# Altium schematic sheet DAC_LFO.SchDoc
size A3; SheetNumber: 2; SheetTotal: 12
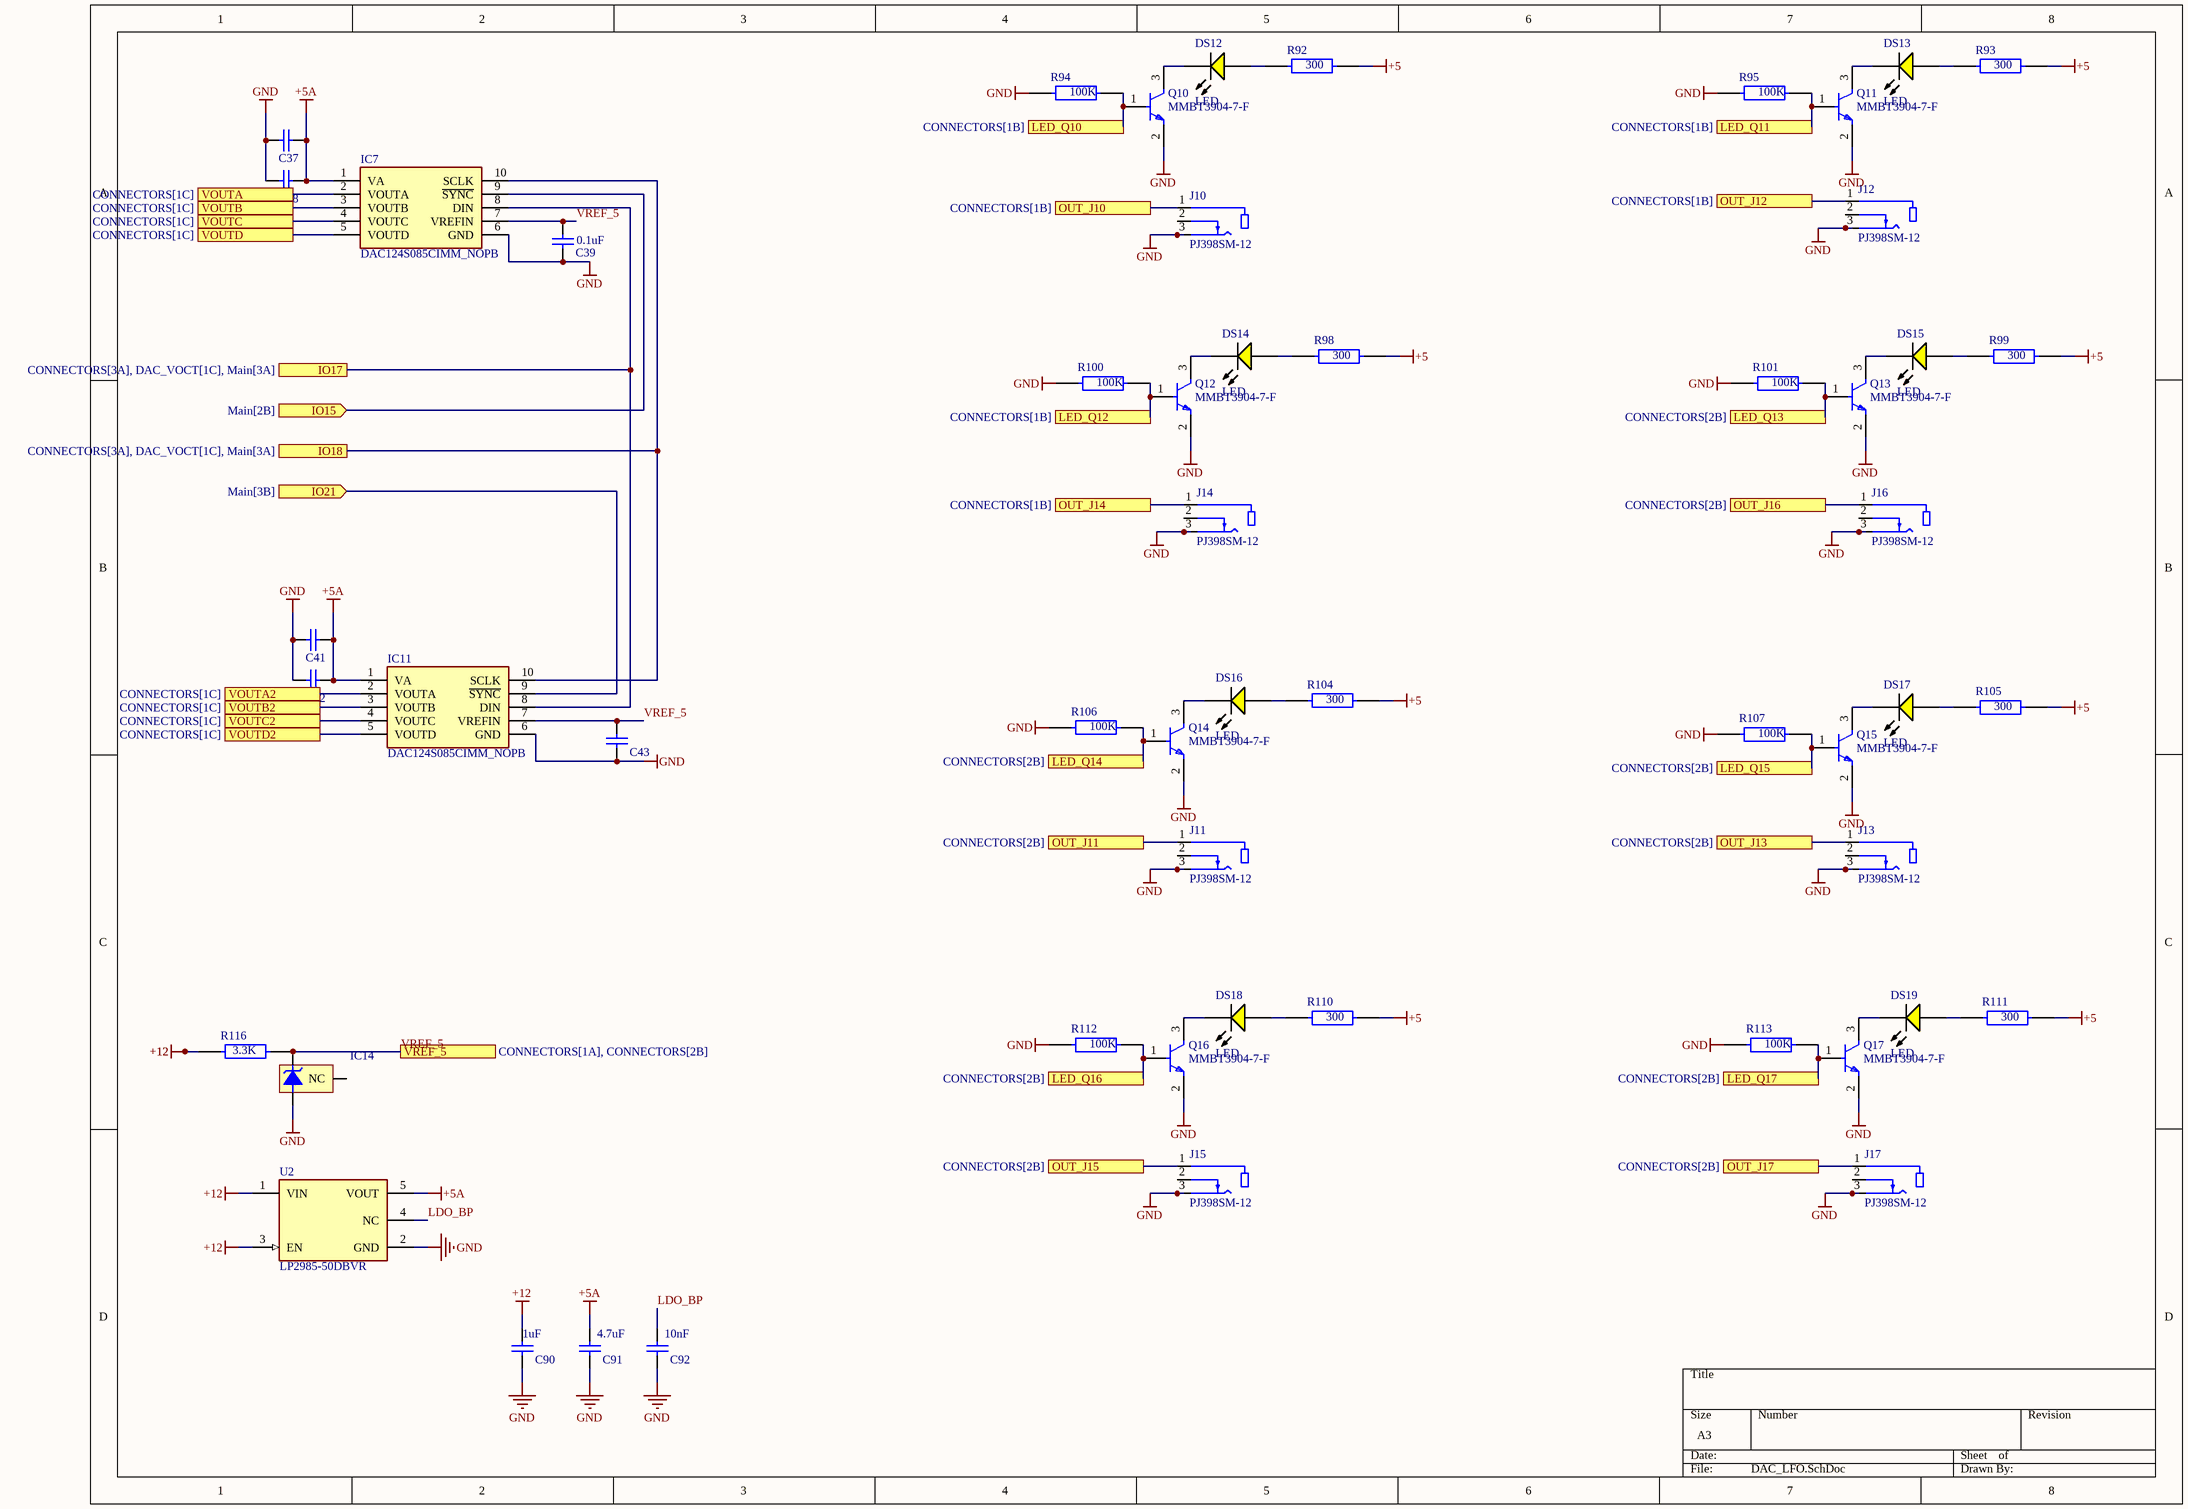
[diagram p0: DAC_LFO.SchDoc]

## Parts
C37  10uF  [CAPC2013X145X48NL20T23]  (value not drawn)
C38  0.1uF  [CAPC2013X145X48NL20T23]  (value not drawn)
C39  0.1uF  [CAPC2013X145X48NL20T23]
C41  10uF  [CAPC2013X145X48NL20T23]  (value not drawn)
C42  0.1uF  [CAPC2013X145X48NL20T23]  (value not drawn)
C43  0.1uF  [CAPC2013X145X48NL20T23]  (value not drawn)
C90  1uF  [CAPC2013X145X48NL20T23]
C91  4.7uF  [CAPC2013X145X48NL20T23]
C92  10nF  [CAPC2013X145X48NL20T23]
DS12  LED  [LED_SSL-LX4673GD-LA20]
DS13  LED  [LED_SSL-LX4673GD-LA20]
DS14  LED  [LED_SSL-LX4673GD-LA20]
DS15  LED  [LED_SSL-LX4673GD-LA20]
DS16  LED  [LED_SSL-LX4673GD-LA20]
DS17  LED  [LED_SSL-LX4673GD-LA20]
DS18  LED  [LED_SSL-LX4673GD-LA20]
DS19  LED  [LED_SSL-LX4673GD-LA20]
IC7  DAC124S085CIMM_NOPB  [SOP50P490X110-10N]
IC11  DAC124S085CIMM_NOPB  [SOP50P490X110-10N]
IC14  LM4040CEM3-5.0/NOPB  [MF03A_L]  (value not drawn)
J10  PJ398SM-12  [THONK_PJ398SM-12]
J11  PJ398SM-12  [THONK_PJ398SM-12]
J12  PJ398SM-12  [THONK_PJ398SM-12]
J13  PJ398SM-12  [THONK_PJ398SM-12]
J14  PJ398SM-12  [THONK_PJ398SM-12]
J15  PJ398SM-12  [THONK_PJ398SM-12]
J16  PJ398SM-12  [THONK_PJ398SM-12]
J17  PJ398SM-12  [THONK_PJ398SM-12]
Q10  MMBT3904-7-F  [3904-SOT23]
Q11  MMBT3904-7-F  [3904-SOT23]
Q12  MMBT3904-7-F  [3904-SOT23]
Q13  MMBT3904-7-F  [3904-SOT23]
Q14  MMBT3904-7-F  [3904-SOT23]
Q15  MMBT3904-7-F  [3904-SOT23]
Q16  MMBT3904-7-F  [3904-SOT23]
Q17  MMBT3904-7-F  [3904-SOT23]
R92  300  [FP-RN73R2A-IPC_A]
R93  300  [FP-RN73R2A-IPC_A]
R94  100K  [FP-RN73R2A-IPC_A]
R95  100K  [FP-RN73R2A-IPC_A]
R98  300  [FP-RN73R2A-IPC_A]
R99  300  [FP-RN73R2A-IPC_A]
R100  100K  [FP-RN73R2A-IPC_A]
R101  100K  [FP-RN73R2A-IPC_A]
R104  300  [FP-RN73R2A-IPC_A]
R105  300  [FP-RN73R2A-IPC_A]
R106  100K  [FP-RN73R2A-IPC_A]
R107  100K  [FP-RN73R2A-IPC_A]
R110  300  [FP-RN73R2A-IPC_A]
R111  300  [FP-RN73R2A-IPC_A]
R112  100K  [FP-RN73R2A-IPC_A]
R113  100K  [FP-RN73R2A-IPC_A]
R116  3.3K  [FP-RN73R2A-IPC_A]
U2  LP2985-50DBVR  [FP-SOT25-IPC_A]

## Ports
IO15 (in, see Main[2B]), IO17 (see CONNECTORS[3A], DAC_VOCT[1C], Main[3A]), IO18 (see CONNECTORS[3A], DAC_VOCT[1C], Main[3A]), IO21 (in, see Main[3B]), LED_Q10 (see CONNECTORS[1B]), LED_Q11 (see CONNECTORS[1B]), LED_Q12 (see CONNECTORS[1B]), LED_Q13 (see CONNECTORS[2B]), LED_Q14 (see CONNECTORS[2B]), LED_Q15 (see CONNECTORS[2B]), LED_Q16 (see CONNECTORS[2B]), LED_Q17 (see CONNECTORS[2B]), OUT_J10 (see CONNECTORS[1B]), OUT_J11 (see CONNECTORS[2B]), OUT_J12 (see CONNECTORS[1B]), OUT_J13 (see CONNECTORS[2B]), OUT_J14 (see CONNECTORS[1B]), OUT_J15 (see CONNECTORS[2B]), OUT_J16 (see CONNECTORS[2B]), OUT_J17 (see CONNECTORS[2B]), VOUTA2 (see CONNECTORS[1C]), VOUTA (see CONNECTORS[1C]), VOUTB2 (see CONNECTORS[1C]), VOUTB (see CONNECTORS[1C]), VOUTC2 (see CONNECTORS[1C]), VOUTC (see CONNECTORS[1C]), VOUTD2 (see CONNECTORS[1C]), VOUTD (see CONNECTORS[1C]), VREF_5 (see CONNECTORS[1A], CONNECTORS[2B])

## Nets
+5: R92.1 R93.1 R98.1 R99.1 R104.1 R105.1 R110.1 R111.1
+5A: C37.2 C38.2 C41.2 C42.2 C91.2 IC7.1(VA) IC11.1(VA) U2.5(VOUT)
+12: C90.2 R116.1 U2.1(VIN) U2.3(EN)
GND: C37.1 C38.1 C39.1 C41.1 C42.1 C43.1 C90.1 C91.1 C92.1 IC7.6(GND) IC11.6(GND) IC14.2(-V) J10.3 J11.3 J12.3 J13.3 J14.3 J15.3 J16.3 J17.3 Q10.2(E) Q11.2(E) Q12.2(E) Q13.2(E) Q14.2(E) Q15.2(E) Q16.2(E) Q17.2(E) R94.2 R95.2 R100.2 R101.2 R106.2 R107.2 R112.2 R113.2 U2.2(GND)
IO15: IC7.9(~{SYNC}) ; port IO15
IO17: IC7.8(DIN) IC11.8(DIN) ; port IO17
IO18: IC7.10(SCLK) IC11.10(SCLK) ; port IO18
IO21: IC11.9(~{SYNC}) ; port IO21
LDO_BP: C92.2 U2.4(NC)
LED_Q10: Q10.1(B) R94.1 ; port LED_Q10
LED_Q11: Q11.1(B) R95.1 ; port LED_Q11
LED_Q12: Q12.1(B) R100.1 ; port LED_Q12
LED_Q13: Q13.1(B) R101.1 ; port LED_Q13
LED_Q14: Q14.1(B) R106.1 ; port LED_Q14
LED_Q15: Q15.1(B) R107.1 ; port LED_Q15
LED_Q16: Q16.1(B) R112.1 ; port LED_Q16
LED_Q17: Q17.1(B) R113.1 ; port LED_Q17
OUT_J10: J10.1 ; port OUT_J10
OUT_J11: J11.1 ; port OUT_J11
OUT_J12: J12.1 ; port OUT_J12
OUT_J13: J13.1 ; port OUT_J13
OUT_J14: J14.1 ; port OUT_J14
OUT_J15: J15.1 ; port OUT_J15
OUT_J16: J16.1 ; port OUT_J16
OUT_J17: J17.1 ; port OUT_J17
VOUTA: IC7.2(VOUTA) ; port VOUTA
VOUTA2: IC11.2(VOUTA) ; port VOUTA2
VOUTB: IC7.3(VOUTB) ; port VOUTB
VOUTB2: IC11.3(VOUTB) ; port VOUTB2
VOUTC: IC7.4(VOUTC) ; port VOUTC
VOUTC2: IC11.4(VOUTC) ; port VOUTC2
VOUTD: IC7.5(VOUTD) ; port VOUTD
VOUTD2: IC11.5(VOUTD) ; port VOUTD2
VREF_5: C39.2 C43.2 IC7.7(VREFIN) IC11.7(VREFIN) IC14.1(+V) R116.2 ; port VREF_5
NetDS12_1: DS12.1(A) R92.2
NetDS12_2: DS12.2(K) Q10.3(C)
NetDS13_1: DS13.1(A) R93.2
NetDS13_2: DS13.2(K) Q11.3(C)
NetDS14_1: DS14.1(A) R98.2
NetDS14_2: DS14.2(K) Q12.3(C)
NetDS15_1: DS15.1(A) R99.2
NetDS15_2: DS15.2(K) Q13.3(C)
NetDS16_1: DS16.1(A) R104.2
NetDS16_2: DS16.2(K) Q14.3(C)
NetDS17_1: DS17.1(A) R105.2
NetDS17_2: DS17.2(K) Q15.3(C)
NetDS18_1: DS18.1(A) R110.2
NetDS18_2: DS18.2(K) Q16.3(C)
NetDS19_1: DS19.1(A) R111.2
NetDS19_2: DS19.2(K) Q17.3(C)

Not connected (* = marked no-connect by the designer): IC14 3(NC); J10 2; J11 2; J12 2; J13 2; J14 2; J15 2; J16 2; J17 2

## Library data of the parts
C37-C39 C41-C43 C90-C92 = CAP: Manufacturer: Vitramon; Part Number: VJ0805Y682KXAMT
DS12-DS19 = LED-Y: Through Hole Lamp, 2.1 V, -55 to 100 degC, 2-Pin THD, RoHS, Bulk; Luminous Intensity: 200 mcd; Illumination Colour: White; Power Rating: 78 mW; Viewing Angle: 140 degrees; Lens Style: Diffused; Nominal Vf: 3.6 V; Case\Package: 0603; Forward Current: 20 mA; Colour: White; Pins: 2; Mount: Surface Mount; Min Operating Temperature: -40 degC; Radiation Hardening: No; Width: 0.8 mm; PackageDescription: 2-Pin Through Hole Device, Dia 3.8 mm, Pitch 2.54 mm; REACH SVHC: No SVHC; DatasheetVersion: Rev. B, 07/2013; Max Operating Temperature: 85 degC; PackageReference: LTL-1CHYE; ComponentLink2URL: https://datasheet.ciiva.com/4269/s-110-ltl-1chye-4269126.pdf; ComponentLink1URL: http://www.us.liteon.com/; Case Code (Imperial): 0603; Height: 0.6 mm; Packaging: Tape and Reel; ComponentLink2Description: Datasheet; Length: 1.6 mm; Package Quantity: 4000; RoHSCompliant: true; ComponentLink1Description: Manufacturer URL; Case Code (Metric): 1608; Forward Voltage: 3.6 V
IC7 IC11 = DAC124S085CIMM_NOPB: 12-Bit Micro Power QUAD Digital-to-Analog Converter with Rail-to-Rail Output; Manufacturer_Name: Texas Instruments; Manufacturer_Part_Number: DAC124S085CIMM/NOPB; Geometry.Height: 1.1mm; Mouser Part Number: 926-DAC124S085CIMMNO; Mouser Price/Stock: https://www.mouser.co.uk/ProductDetail/Texas-Instruments/DAC124S085CIMM-NOPB?qs=7X5t%252BdzoRHBv34DgWfHrUA%3D%3D; Datasheet Link: http://www.ti.com/lit/gpn/dac124s085
IC14 = lm4040: Precision Micropower Shunt Voltage Reference, 3-pin SOT-23, Pb-Free; Manufacturer: National Semiconductor; PackageTopMarking: R5C*XTT; PowerWise: N; CompType: Voltage Reference IC; ComponentLink1URL: http://www.national.com/ds/LM/LM4040.pdf; PinCount: 3; ComponentLink2Description: LM4040 Web Page; ComponentLink3URL: http://www.national.com/packaging/folders/mf03a.html; RevisionNote: Component URLs added; PackageVersion: revB, Mar-2003; ComponentLink2URL: http://www.national.com/pf/LM/LM4040.html; ComponentLink3Description: MF03A Package Page; PackageReference: MF03A; RoHS: Y; DatasheetVersion: Apr-2005; PackageDescription: Molded SOT-23, .115 x .051 x .037in Body, 3 Lead, .075 in Pitch; ComponentLink1Description: LM4040 Datasheet
J10-J17 = PJ398SM-12: 3.5mm Switching Jack Socket; MF: Thonk; Availability: Not in stock; Price: None; Package: Package; MP: PJ398SM-12; Value: *
Q10-Q17 = 3904: TRANS NPN 40V 0.2A SMD SOT23-3; Frequency: 300MHz; Power Dissipation: 350mW; Element Configuration: Single; Max Power Dissipation: 300mW; Max Collector Current: 200mA; Collector Emitter Saturation Voltage: 300mV; Number of Elements: 1; hFE Min: 100; Collector Base Voltage (VCBO): 60V; Emitter Base Voltage (VEBO): 6V; Contact Plating: Tin; Package Quantity: 3000; Max Frequency: 300MHz; REACH SVHC: No SVHC; Max Operating Temperature: 150°C; Width: 1.4mm; Collector Emitter Voltage (VCEO): 40V; Voltage Rating (DC): 40V; Radiation Hardening: No; Case/Package: SOT-23; Height: 1mm; Collector Emitter Breakdown Voltage: 40V; Length: 3.05mm; Polarity: NPN; Packaging: Tape and Reel; Number of Pins: 3; Min Operating Temperature: -55°C; Gain Bandwidth Product: 300MHz; Mount: Surface Mount; Weight: 0.000282oz; Continuous Collector Current: 200mA; Transition Frequency: 300MHz; Max Breakdown Voltage: 40V; Lead Free: Lead Free
R92-R95 R98-R101 R104-R107 R110-R113 R116 = Resistor: RES 10K OHM 0.1% 1/8W 0805
U2 = CMP-12756-000035-1: Low-noise LDO 5.0 V 150 mA, SOT-23-5 (DAC supply +5A); Number of Regulators: 1; Output Current: 600mA; Output Type: Fixed; Polarity: Positive; Min Input Voltage: 2.5V; Output Voltage: 3.3V; Max Input Voltage: 6V; Accuracy: 1.5%; Quiescent Current: 55uA; Dropout Voltage: 250mV; Min Operating Temperature: -40°C; Length: 3.1mm; Max Operating Temperature: 85°C; Package Quantity: 1; Width: 1.7mm; Number of Outputs: 1; Packaging: Tape and Reel; Height: 1.3mm; Lead Free: Lead Free; Max Output Current: 600mA; Case/Package: SOT-23-5; Mount: Surface Mount; Number of Pins: 5